# Altium schematic sheet MIPI-CSI_RXX_INTERFACE.SchDoc
size A4; SheetNumber: 22; SheetTotal: 26
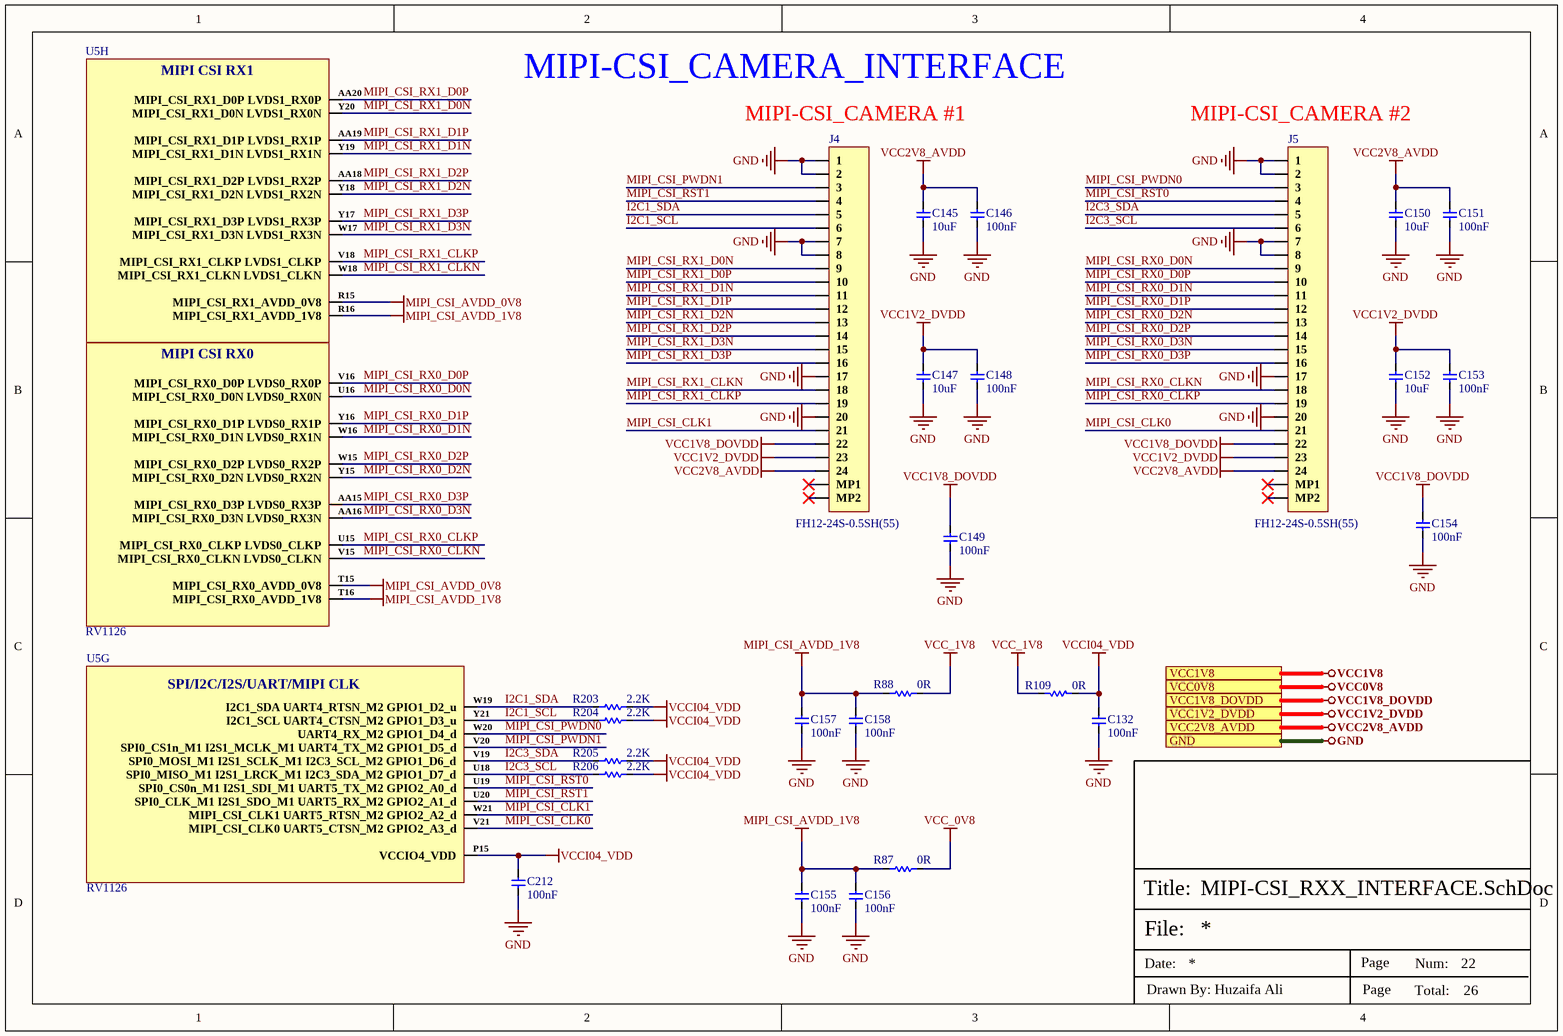
[diagram p0: MIPI-CSI_RXX_INTERFACE.SchDoc]

## Parts
C132  100nF  [CAP-0201]
C145  10uF  [Cap-0603]
C146  100nF  [CAP-0201]
C147  10uF  [Cap-0603]
C148  100nF  [CAP-0201]
C149  100nF  [CAP-0201]
C150  10uF  [Cap-0603]
C151  100nF  [CAP-0201]
C152  10uF  [Cap-0603]
C153  100nF  [CAP-0201]
C154  100nF  [CAP-0201]
C155  100nF  [CAP-0201]
C156  100nF  [CAP-0201]
C157  100nF  [CAP-0201]
C158  100nF  [CAP-0201]
C212  100nF  [CAP-0201]
J4  FH12-24S-0.5SH(55)  [FH12-24S-0.5SH(55)_]
J5  FH12-24S-0.5SH(55)  [FH12-24S-0.5SH(55)_]
R87  0R  [Res-0402]
R88  0R  [Res-0402]
R109  0R  [Res-0402]
R203  2.2K  [Res-0402]
R204  2.2K  [Res-0402]
R205  2.2K  [Res-0402]
R206  2.2K  [Res-0402]
U5  RV1126  [FCCSP-409(14x14)]  (parts G,H of 15)

## Ports
GND (see DDR3_SDRAM_INTERFACE[5D], DEBUG_UART_INTERFACE[3D], DIGITAL_MEMS_MIC_INTERFACE[3C], eMMC_INTERFACE[3D], ETHERNET_PoE-PD_INTERFACE[4D], ETHERNET_SWITCH_INTERFACE[5D], IR-CUT_LIGHT SENSOR_SHEET[3D], MIPI TO HDMI_MODULE_INTERFACE[3D], PoE_PSE_CONTROLLER[5D], POWER_LDO_SHEET[3D], POWER_PMIC_RK809_CODEC[3C], POWER_PMIC_RK809_DC DC[3D], POWER_PMIC_RK809_LDO[4C], POWER_PMIC_RK809_MANAGEMENT[3D], RV1126_AUDIO_SHEET[3D], RV1126_DRAM_SHEET[4C], RV1126_eMMC_SPI-FLASH[3C], RV1126_ETHERNET_SHEET[3D], RV1126_OSC-PLL-PMUIO[3C], RV1126_POWER_SHEET[1D], RV1126_SARADC_SHEET[3C], RV1126_SDMMC_SHEET[3C], SPI_FLASH_INTERFACE[3D], SYNCHRONOUS _BUCK_CONTROLLER[3D], USB2.0_DEBUG_UART[3D], WIFI_AP6256_SHEET[3C]), VCC0V8 (see MIPI TO HDMI_MODULE_INTERFACE[3D], POWER_PMIC_RK809_LDO[4C], USB2.0_DEBUG_UART[3D]), VCC1V2_DVDD (see POWER_PMIC_RK809_LDO[4C]), VCC1V8 (see DIGITAL_MEMS_MIC_INTERFACE[3C], IR-CUT_LIGHT SENSOR_SHEET[3D], MIPI TO HDMI_MODULE_INTERFACE[3D], POWER_PMIC_RK809_LDO[4C], POWER_PMIC_RK809_MANAGEMENT[3D], RV1126_AUDIO_SHEET[3D], RV1126_eMMC_SPI-FLASH[3C], RV1126_ETHERNET_SHEET[3D], RV1126_OSC-PLL-PMUIO[3C], RV1126_SARADC_SHEET[3C], RV1126_SDMMC_SHEET[3C], USB2.0_DEBUG_UART[3D], WIFI_AP6256_SHEET[3C]), VCC1V8_DOVDD (see POWER_PMIC_RK809_LDO[4C]), VCC2V8_AVDD (see POWER_PMIC_RK809_LDO[4C])

## Nets
GND: C132.1 C145.1 C146.1 C147.1 C148.1 C149.1 C150.1 C151.1 C152.1 C153.1 C154.1 C155.1 C156.1 C157.1 C158.1 C212.1 J4.1 J4.2 J4.7 J4.8 J4.17 J4.20 J5.1 J5.2 J5.7 J5.8 J5.17 J5.20 ; port GND
MIPI_CSI_AVDD_0V8: U5.R15(MIPI_CSI_RX1_AVDD_0V8) U5.T15(MIPI_CSI_RX0_AVDD_0V8)
MIPI_CSI_AVDD_1V8: C155.2 C156.2 C157.2 C158.2 R87.1 R88.1 U5.R16(MIPI_CSI_RX1_AVDD_1V8) U5.T16(MIPI_CSI_RX0_AVDD_1V8)
VCC0V8: port VCC0V8
VCC1V2_DVDD: C147.2 C148.2 C152.2 C153.2 J4.23 J5.23 ; port VCC1V2_DVDD
VCC1V8: port VCC1V8
VCC1V8_DOVDD: C149.2 C154.2 J4.22 J5.22 ; port VCC1V8_DOVDD
VCC2V8_AVDD: C145.2 C146.2 C150.2 C151.2 J4.24 J5.24 ; port VCC2V8_AVDD
VCC_0V8: R87.2
VCC_1V8: R88.2 R109.2
VCCI04_VDD: C132.2 C212.2 R109.1 R203.2 R204.2 R205.2 R206.2 U5.P15(VCCIO4_VDD)
I2C1_SCL: J4.6 R204.1 U5.Y21(I2C1_SCL_UART4_CTSN_M2_GPIO1_D3_u)
I2C1_SDA: J4.5 R203.1 U5.W19(I2C1_SDA_UART4_RTSN_M2_GPIO1_D2_u)
I2C3_SCL: J5.6 R206.1 U5.U18(SPI0_MISO_M1_I2S1_LRCK_M1_I2C3_SDA_M2_GPIO1_D7_d)
I2C3_SDA: J5.5 R205.1 U5.V19(SPI0_MOSI_M1_I2S1_SCLK_M1_I2C3_SCL_M2_GPIO1_D6_d)
MIPI_CSI_CLK0: J5.21 U5.V21(MIPI_CSI_CLK0_UART5_CTSN_M2_GPIO2_A3_d)
MIPI_CSI_CLK1: J4.21 U5.W21(MIPI_CSI_CLK1_UART5_RTSN_M2_GPIO2_A2_d)
MIPI_CSI_PWDN0: J5.3 U5.W20(UART4_RX_M2_GPIO1_D4_d)
MIPI_CSI_PWDN1: J4.3 U5.V20(SPI0_CS1n_M1_I2S1_MCLK_M1_UART4_TX_M2_GPIO1_D5_d)
MIPI_CSI_RST0: J5.4 U5.U19(SPI0_CS0n_M1_I2S1_SDI_M1_UART5_TX_M2_GPIO2_A0_d)
MIPI_CSI_RST1: J4.4 U5.U20(SPI0_CLK_M1_I2S1_SDO_M1_UART5_RX_M2_GPIO2_A1_d)
MIPI_CSI_RX0_CLKN: J5.18 U5.V15(MIPI_CSI_RX0_CLKN_LVDS0_CLKN)
MIPI_CSI_RX0_CLKP: J5.19 U5.U15(MIPI_CSI_RX0_CLKP_LVDS0_CLKP)
MIPI_CSI_RX0_D0N: J5.9 U5.U16(MIPI_CSI_RX0_D0N_LVDS0_RX0N)
MIPI_CSI_RX0_D0P: J5.10 U5.V16(MIPI_CSI_RX0_D0P_LVDS0_RX0P)
MIPI_CSI_RX0_D1N: J5.11 U5.W16(MIPI_CSI_RX0_D1N_LVDS0_RX1N)
MIPI_CSI_RX0_D1P: J5.12 U5.Y16(MIPI_CSI_RX0_D1P_LVDS0_RX1P)
MIPI_CSI_RX0_D2N: J5.13 U5.Y15(MIPI_CSI_RX0_D2N_LVDS0_RX2N)
MIPI_CSI_RX0_D2P: J5.14 U5.W15(MIPI_CSI_RX0_D2P_LVDS0_RX2P)
MIPI_CSI_RX0_D3~{N}: J5.15 U5.AA16(MIPI_CSI_RX0_D3N_LVDS0_RX3N)
MIPI_CSI_RX0_D3P: J5.16 U5.AA15(MIPI_CSI_RX0_D3P_LVDS0_RX3P)
MIPI_CSI_RX1_CLKN: J4.18 U5.W18(MIPI_CSI_RX1_CLKN_LVDS1_CLKN)
MIPI_CSI_RX1_CLKP: J4.19 U5.V18(MIPI_CSI_RX1_CLKP_LVDS1_CLKP)
MIPI_CSI_RX1_D0N: J4.9 U5.Y20(MIPI_CSI_RX1_D0N_LVDS1_RX0N)
MIPI_CSI_RX1_D0P: J4.10 U5.AA20(MIPI_CSI_RX1_D0P_LVDS1_RX0P)
MIPI_CSI_RX1_D1N: J4.11 U5.Y19(MIPI_CSI_RX1_D1N_LVDS1_RX1N)
MIPI_CSI_RX1_D1P: J4.12 U5.AA19(MIPI_CSI_RX1_D1P_LVDS1_RX1P)
MIPI_CSI_RX1_D2N: J4.13 U5.Y18(MIPI_CSI_RX1_D2N_LVDS1_RX2N)
MIPI_CSI_RX1_D2P: J4.14 U5.AA18(MIPI_CSI_RX1_D2P_LVDS1_RX2P)
MIPI_CSI_RX1_D3N: J4.15 U5.W17(MIPI_CSI_RX1_D3N_LVDS1_RX3N)
MIPI_CSI_RX1_D3P: J4.16 U5.Y17(MIPI_CSI_RX1_D3P_LVDS1_RX3P)

Not connected (* = marked no-connect by the designer): J4 MP1* MP2*; J5 MP1* MP2*

## Notes on the sheet
- MIPI-CSI_CAMERA_INTERFACE
- (near J4) MIPI-CSI_CAMERA #1
- (near J5) MIPI-CSI_CAMERA #2
- File:
- Title:
- Date:
- Page
- Num:
- Total:
- Drawn By: Huzaifa Ali
- (in symbol RV1126, part G) SPI/I2C/I2S/UART/MIPI CLK
- (in symbol RV1126, part H) MIPI CSI RX1; MIPI CSI RX0

## Library data of the parts
C132 C146 C148 C149 C151 C153-C158 C212 = CC0201KRX5R6BB104: CAP CER 0.1UF 10V X5R 0201; Manufacturer: Yageo; Tolerance: 10%; Supplier 1: Mouser; Manufacturer Part Number: CC0201KRX5R6BB104; RoHS: Yes; Category: Ceramic Capacitors; Stock 1: 824403; Pricing 1: 1=0.10000, 10=0.02400, 50=0.02400, 100=0.01900, 1000=0.01100, 10000=0.00900 (USD); Mount: Surface Mount; Case/Package: 0201; Case Code (Imperial): 0201; Case Code (Metric): 0603; Weight: 6E-06oz; Min Operating Temperature: -55°C; Max Operating Temperature: 85°C; Capacitance: 100nF; Dielectric: X5R; Voltage Rating (DC): 10V; Packaging: Tape and Reel; Termination: SMD/SMT; Resistor Type: Ceramic; Voltage Rating: 10V; Series: CC; Construction: Flat; Length: 0.6mm; Width: 0.012inch; Height: 0.3mm; Thickness: 0.013inch; Depth: 0.3mm; Radiation Hardening: No; Lead Free: Lead Free; Halogen Free: Halogen Free; RoHS Compliant: Yes; ComponentLink1URL: https://datasheet.ciiva.com/11587/upy-gphc-x5r-4v-to-50v-12-11587190.pdf?src-supplier=Avnet; ComponentLink1Description: https://datasheet.ciiva.com/11587/upy-gphc-x5r-4v-to-50v-12-11587190.pdf?src-supplier=Avnet; Supplier Part Number 1: 603-CC201KRX5R6BB104; LCSC Part Number: C190183
C145 C147 C150 C152 = CC0603KRX5R6BB106: CAP CER 10UF 10V X5R 0603; Manufacturer: Yageo; Tolerance: 10%; Item Type: Capacitor; Supplier 1: Digi-Key; Manufacturer Part Number: CC0603KRX5R6BB106; RoHS: Yes; Category: Ceramic Capacitors; Stock 1: 187515; Pricing 1: 1=0.24000, 10=0.16300, 50=0.09780, 100=0.08260, 500=0.05654, 1000=0.05001 (USD); Mount: Surface Mount; Case/Package: 0603; Case Code (Metric): 1608; Case Code (Imperial): 0603; Weight: 7.1E-05oz; Min Operating Temperature: -55°C; Max Operating Temperature: 85°C; Capacitance: 10uF; Packaging: Tape and Reel; Dielectric: X5R; Voltage Rating: 10V; Termination: SMD/SMT; Resistor Type: Ceramic; Voltage Rating (DC): 10V; Package Quantity: 4000; Length: 0.063inch; Width: 0.031inch; Thickness: 0.035inch; Depth: 0.8mm; Lead Free: Lead Free; Halogen Free: Halogen Free; RoHS Compliant: Yes; ComponentLink1URL: http://www.mouser.com/ds/2/447/Yageo_UPY-GP_NP0_16V-to-50V_9-358835.pdf?src-supplier=Mouser; ComponentLink1Description: http://www.mouser.com/ds/2/447/Yageo_UPY-GP_NP0_16V-to-50V_9-358835.pdf?src-supplier=Mouser; ComponentLink2URL: http://www.yageo.com/documents/recent/UPY-GPHC_X5R_4V-to-50V_25.pdf?src-supplier=Digi-Key; ComponentLink2Description: http://www.yageo.com/documents/recent/UPY-GPHC_X5R_4V-to-50V_25.pdf?src-supplier=Digi-Key; Supplier Part Number 1: 311-1782-1-ND; LCSC Part Number: C326057
J4 J5 = FH12-24S-0.5SH(55): CONN FFC BOTTOM 24POS 0.50MM R/A; Manufacturer: Hirose; Item Type: FFC Connector; Supplier 1: RSComponents; Manufacturer Part Number: FH12-24S-0.5SH(55); RoHS: Yes; Category: FFC / FPC; Stock 1: 30; Pricing 1: 5=0.91700, 100=0.76200, 375=0.63900, 1500=0.59600, 3000=0.55300 (USD); ComponentLink1URL: https://datasheet.ciiva.com/15176/getdatasheetpartid-439675-15176853.pdf?src-supplier=Verical; ComponentLink1Description: https://datasheet.ciiva.com/15176/getdatasheetpartid-439675-15176853.pdf?src-supplier=Verical; ComponentLink2URL: https://datasheet.ciiva.com/22630/58803-22630351.pdf?src-supplier=Farnell; ComponentLink2Description: https://datasheet.ciiva.com/22630/58803-22630351.pdf?src-supplier=Farnell; ComponentLink3URL: https://datasheet.ciiva.com/5137/ed-fh12-20140305-355586-5137161.pdf?src-supplier=Mouser; ComponentLink3Description: https://datasheet.ciiva.com/5137/ed-fh12-20140305-355586-5137161.pdf?src-supplier=Mouser; ComponentLink4URL: https://datasheet.ciiva.com/22697/58803-22697094.pdf?src-supplier=Element14; ComponentLink4Description: https://datasheet.ciiva.com/22697/58803-22697094.pdf?src-supplier=Element14; ComponentLink5URL: https://datasheet.ciiva.com/7661/58803-7661382.pdf?src-supplier=Element14; ComponentLink5Description: https://datasheet.ciiva.com/7661/58803-7661382.pdf?src-supplier=Element14; Supplier Part Number 1: 7388827; LCSC Part Number: C202112
R87 R88 = RCS04020000Z0ED: RES SMD 0 OHM JUMPER 1/5W 0402; Manufacturer: Vishay Dale; Resistance: 0mR; Max Power Dissipation: 200mW; Item Type: Resistor; Supplier 1: Digi-Key; Manufacturer Part Number: RCS04020000Z0ED; Stock 1: 35470; Pricing 1: 1=0.1, 10=0.083, 25=0.0576, 50=0.0448, 100=0.032, 250=0.02496, 500=0.01984, 1000=0.01408, 5000=0.01088 (USD); Case/Package: 0402; Case Code (Metric): 1005; Case Code (Imperial): 0402; Min Operating Temperature: -55°C; Max Operating Temperature: 155°C; Packaging: Tape and Reel; Resistor Type: Thick Film; Number of Terminations: 2; Features: Automotive AEC-Q200; Length: 0.039inch; Width: 0.02inch; Height: 0.016inch; RoHS Compliant: Yes; ComponentLink1URL: http://www.farnell.com/datasheets/2618474.pdf?src-supplier=Farnell; ComponentLink1Description: http://www.farnell.com/datasheets/2618474.pdf?src-supplier=Farnell; ComponentLink2URL: http://www.farnell.com/datasheets/2618474.pdf?src-supplier=Element14; ComponentLink2Description: http://www.farnell.com/datasheets/2618474.pdf?src-supplier=Element14; ComponentLink3URL: http://www.vishay.com/docs/20065/rcse3.pdf?src-supplier=Digi-Key; ComponentLink3Description: http://www.vishay.com/docs/20065/rcse3.pdf?src-supplier=Digi-Key; ComponentLink4URL: http://www.farnell.com/datasheets/2618474.pdf?src-supplier=Newark; ComponentLink4Description: http://www.farnell.com/datasheets/2618474.pdf?src-supplier=Newark; Supplier Part Number 1: 541-2877-1-ND; LCSC Part Number: C844673
R109 = RC0402FR-070RL: RES 0 OHM JUMPER 1/16W 0402; Manufacturer: Yageo; Item Type: Resistors; Tolerance: 1%; Power Rating: 62.5mW; Voltage Rating: 50V; Temperature Coefficient: 200ppm/°C; Max Power Dissipation: 63mW; Supplier 1: Mouser; Manufacturer Part Number: RC0402FR-070RL; RoHS: Yes; Stock 1: 8556842; Pricing 1: 1=0.10000, 10=0.01400, 50=0.01400, 100=0.00600, 1000=0.00300, 5000=0.00200, 10000=0.00100 (USD); Mount: Surface Mount; Case/Package: 0402; Contact Plating: Tin,Matte; Case Code (Imperial): 0402; Case Code (Metric): 1005; Size Code: 0402; Min Operating Temperature: -55°C; Max Operating Temperature: 155°C; Resistance: 0R; Resistor Type: Thick Film; Packaging: Tape and Reel; Termination: SMD/SMT; Features: Moisture Resistant; Series: RC; Number of Terminations: 2; Length: 1mm; Width: 0.5mm; Height: 0.35mm; Radiation Hardening: No; Lead Free: Lead Free; RoHS Compliant: Yes; ComponentLink1URL: https://datasheet.ciiva.com/8896/pyu-rc0402-51-rohs-l-6-8896149.pdf?src-supplier=Avnet; ComponentLink1Description: https://datasheet.ciiva.com/8896/pyu-rc0402-51-rohs-l-6-8896149.pdf?src-supplier=Avnet; ComponentLink2URL: https://datasheet.ciiva.com/16790/pyu-rc0402-51-rohs-l-6-r-16790444.pdf?src-supplier=Future+Electronics; ComponentLink2Description: https://datasheet.ciiva.com/16790/pyu-rc0402-51-rohs-l-6-r-16790444.pdf?src-supplier=Future+Electronics; Supplier Part Number 1: 603-RC0402FR-070RL; LCSC Part Number: C106231
R203-R206 = RC0402FR-072K2L: RES SMD 2.2K OHM 1% 1/16W 0402; Manufacturer: Yageo; Resistance: 2.2kR; Power Rating: 63mW; Voltage Rating: 50V; Temperature Coefficient: 100ppm/°C; Supplier 1: Digi-Key; Manufacturer Part Number: RC0402FR-072K2L; Stock 1: 966157; Pricing 1: 1=0.1, 10=0.016, 100=0.0066, 1000=0.00299, 2500=0.00259, 5000=0.00214 (USD); Case/Package: 0402; Case Code (Imperial): 0402; Case Code (Metric): 1005; Weight: 2.3E-05oz; Size Code: 0402; Min Operating Temperature: -55°C; Max Operating Temperature: 155°C; Resistor Type: Thick Film; Packaging: Tape and Reel; Tolerance: 1%; Termination: SMD/SMT; Features: Moisture Resistant; Series: RC; Max Power Dissipation: 63mW; Number of Terminations: 2; Resistance Tolerance: 1%; Construction: Rectangular; Technology: THICK FILM; Length: 1mm; Width: 0.5mm; Height: 0.35mm; Depth: 0.5mm; RoHS Compliant: Yes; REACH SVHC: Unknown; Military Standard: Not; Lead Free: Lead Free; ComponentLink1URL: http://www.farnell.com/datasheets/2167052.pdf?src-supplier=Element14; ComponentLink1Description: http://www.farnell.com/datasheets/2167052.pdf?src-supplier=Element14; ComponentLink2URL: http://www.yageo.com/documents/recent/PYu-RC_Group_51_RoHS_L_9.pdf?src-supplier=Mouser; ComponentLink2Description: http://www.yageo.com/documents/recent/PYu-RC_Group_51_RoHS_L_9.pdf?src-supplier=Mouser; ComponentLink3URL: http://documents.rs-components.com/techlib://itc_doclist_GB.htm?stockno=6186532&src-supplier=RSComponents; ComponentLink3Description: http://documents.rs-components.com/techlib://itc_doclist_GB.htm?stockno=6186532&src-supplier=RSComponents; ComponentLink4URL: http://www.yageo.com/documents/recent/PYu-RC0402_51_RoHS_L_6_r.pdf?src-supplier=Future+Electronics; ComponentLink4Description: http://www.yageo.com/documents/recent/PYu-RC0402_51_RoHS_L_6_r.pdf?src-supplier=Future+Electronics; Supplier Part Number 1: 311-2.20KLRCT-ND; LCSC Part Number: C114762
U5 = RV1126: FCCSP-409(14x14) Microcontroller Units (MCUs/MPUs/SOCs) ROHS; Manufacturer: Rockchip; Manufacturer Part Number: RV1126; Package: FCCSP-409(14x14); LCSC Part Number: C2859017; Item Type: Microcontroller; ComponentLink1Description: LCSC; ComponentLink1URL: https://www.lcsc.com/product-detail/Microcontroller-Units-MCUs-MPUs-SOCs_Rockchip-RV1126_C2859017.html